# Altium project emergency_pcb.PrjPcb
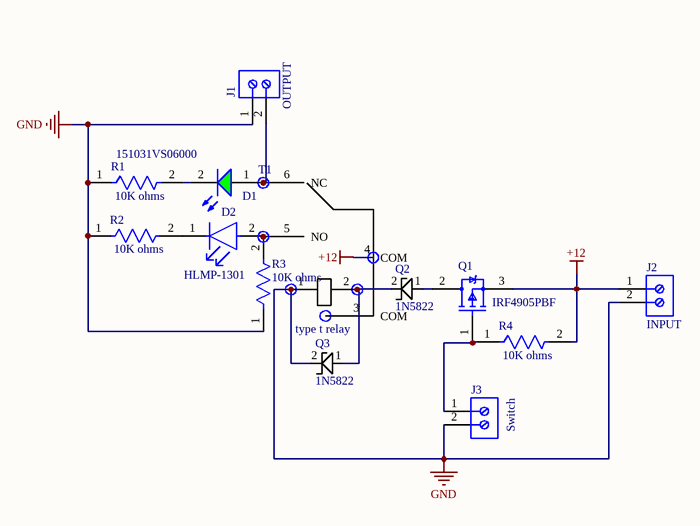
[diagram p0: emergency_schematic.SchDoc]
1 sheet, 13 parts. Net scope: global (net labels, ports and power ports of the same name join across sheets).
Board file: emergency_pcb.PcbDoc

## Sheet emergency_schematic.SchDoc
size A4; SheetNumber: 1; SheetTotal: 1

### Parts
D1  151031VS06000  [WL-TMRC_D3.95H5.3]
D2  HLMP-1301  [FP-HLMP-1301-MFG]
J1  OUTPUT  [691211720002]
J2  INPUT  [691211720002]
J3  Switch  [691211720002]
Q1  IRF4905PBF  [FP-PG-TO220-3-MFG]
Q2  1N5822  [1N5882 schotky diode]
Q3  1N5822  [1N5882 schotky diode]
R1  10K ohms  [FP-CF18-MFG]
R2  10K ohms  [FP-CF18-MFG]
R3  10K ohms  [FP-CF18-MFG]
R4  10K ohms  [FP-CF18-MFG]
T1  type t relay  [type t relay]

### Nets
+12: J2.1 Q1.3(SOURCE) R4.2 T1.4(COM)
GND: J1.1 J2.2 J3.2 Q3.2(GND17) R1.1 R2.1 R3.1 T1.1(A)
NetD1_1: D1.1(A) J1.2 T1.6(NC)
NetD1_2: D1.2(K) R1.2
NetD2_1: D2.1(C) R2.2
NetD2_2: D2.2(A) R3.2 T1.5(NO)
NetJ3_1: J3.1 Q1.1(GATE) R4.1
NetQ1_2: Q1.2(DRAIN) Q2.1(GND16)
NetQ2_2: Q2.2(GND17) Q3.1(GND16) T1.2(GND21)

Not connected (* = marked no-connect by the designer): T1 3(COM)

### Library data of the parts
D1 = CMP-1488-00004-3: Led, Green, T-1 (3Mm), 568 Nm, 2.2 V, 30 Ma, 20 Mcd Rohs Compliant: Yes; Manufacturer Lifecycle Status: ACTIVE; Test Current: 20mA; Wavelength: 568nm; Forward Voltage: 2.2V; Viewing Angle: 60°; Lens Style: Circular, Diffused, Round; Max Reverse Voltage (DC): 5V; YEOL: 1 = Estimated lifetime > 10 years; Forward Current: 100mA; Peak Wavelength: 560nm; Luminous Intensity: 30mcd; Case/Package: Radial; Color: Green; Lifecycle Status: Production; Height: 5.3mm; Min Operating Temperature: -40°C; Length: 3mm; RoHS: Compliant; Max Operating Temperature: 85°C; Dominant Wavelength: 568nm; Mount: Through Hole; Lead Free: Lead Free; Lens Size: 3mm; Width: 3mm; Packaging: Bulk; REACH SVHC: Unknown
D2 = CMP-18399-000007-1: LED RED DIFFUSED T-1 T/H; Manufacturer: Broadcom; Forward Current: 10mA; Max Junction Temp: +110°C; Wavelength: 626nm; Led Orientation: Straight; Viewing Angle: 60°; Luminous Intensity: 3.4mcd; Forward Voltage: 1.9V; Reverse Voltage: 5V; Peak Emmision Wavelength: 635nm; Mouser Description: Standard LEDs - Through Hole Red Diffused 635nm 3.4mcd; RoHS: TRUE; ComponentLink2Description: Datasheet; Device Class L1: Optoelectronics; Temperature Range High: +100°C; Manufacturer Part Number: HLMP-1301; ComponentLink2URL: https://docs.broadcom.com/docs/AV02-1555EN; Colour: Red; Digikey Description: LED RED DIFFUSED T-1 T/H; Automotive: No; Device Class L2: LEDs; Temperature Range Low: -40°C; Octopart: https://octopart.com/hlmp-1301-broadcom-71130345; Category: Diode; Lead Free: Yes; Device Class L3: unset; Package: 0; Temperature: -40°C to +100°C
J1-J3 = CMP-1502-02524-3: 211 Series 5MM Pitch Straight, Pcb Terminal Block, Through Hole, 2 Way; Number of Levels: 1; Current: 10A; Voltage: 300V; Pitch: 5.0038mm; Wire Gauge (Min): 12AWG; Connector Type: PCB, Terminal Block; Number of Positions Per Level: 2; Plating: Brass, Steel; Wire Gauge (Max): 24AWG; Stripping Length: -7mm; Termination: Screw; Height: 15.5mm; Contact Plating: Tin; REACH SVHC: Unknown; Contact Material: Brass; Width: 10mm; RoHS: Compliant; Number of Pins: 2; Lead Pitch: 5mm; Mount: Through Hole; Min Operating Temperature: -40°C; Length: 13.7mm; Number of Contacts: 2; Color: Green; Wire/Cable Gauge: 12AWG; Housing Material: Nylon; Packaging: Box; Max Operating Temperature: 105°C
Q1 = CMP-32901-000200-1: MOSFET P-CH 55V 74A TO-220AB; Drain to Source Resistance: 20mR; Input Capacitance: 3.4nF; Max Dual Supply Voltage: -55V; Power Dissipation: 200W; Turn-On Delay Time: 18ns; Element Configuration: Single; Threshold Voltage: -4V; Gate to Source Voltage (Vgs): 20V; Turn-Off Delay Time: 61ns; Number of Pins: 3; Packaging: Rail/Tube; RoHS Compliant: Yes; REACH SVHC: No SVHC; Halogen Free: Halogen Free; Max Power Dissipation: 200W; Drain to Source Breakdown Voltage: -55V; Length: 0.414inch; Drain to Source Voltage (Vdss): -55V; Height: 0.6inch; Case/Package: TO-220; Width: 0.185inch; Continuous Drain Current (ID): 74A; Mount: Through Hole; Min Operating Temperature: -55°C; Lead Free: Lead Free; Max Operating Temperature: 175°C; Rds On Max: 20mR
Q2 Q3 = 1N5822: Schotky diode
R1-R4 = CMP-26528-000002-1: RES 10K OHM 1/8W 5% CF AXIAL; Manufacturer Part Number: CF18JT10K0; Manufacturer: Stackpole Electronics; Power Rating: 0.125W; Temperature Coefficient: 0-500ppm/°C; Resistance: 10kΩ; Voltage Rating: 250V; Value: 10kΩ; Temperature: -55°C to +155°C; Height: 2mm; Lead Free: Yes; Automotive: No; Device Class L2: Resistors; Package: CF18; Series: CF; ComponentLink2Description: Datasheet; Ipc Land Pattern Name: RESAD656W65L360D200; Temperature Range High: +155°C; RoHS: TRUE; Device Class L3: Through-Hole Resistors; Temperature Range Low: -55°C; Device Class L1: Passive Components; Category: Res; Octopart: https://octopart.com/cf18jt10k0-stackpole+electronics-19205642; Composition: Carbon Film; Digikey Description: RES 10K OHM 1/8W 5% CF AXIAL; ComponentLink2URL: http://www.seielect.com/Catalog/SEI-CF_CFM.pdf; Tolerance: 5%